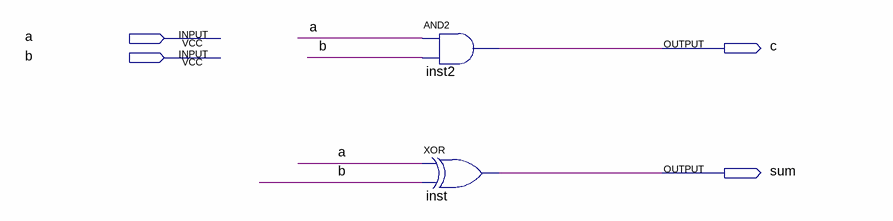
[diagram p0: schematic sheet]
// Quartus schematic ADD.bdf as structural Verilog: 2 symbols, 4 pins
module ADD (
  input  a,
  input  b,
  output c,
  output sum
);

  and inst2 (c, a, b);
  xor inst (sum, a, b);
endmodule
